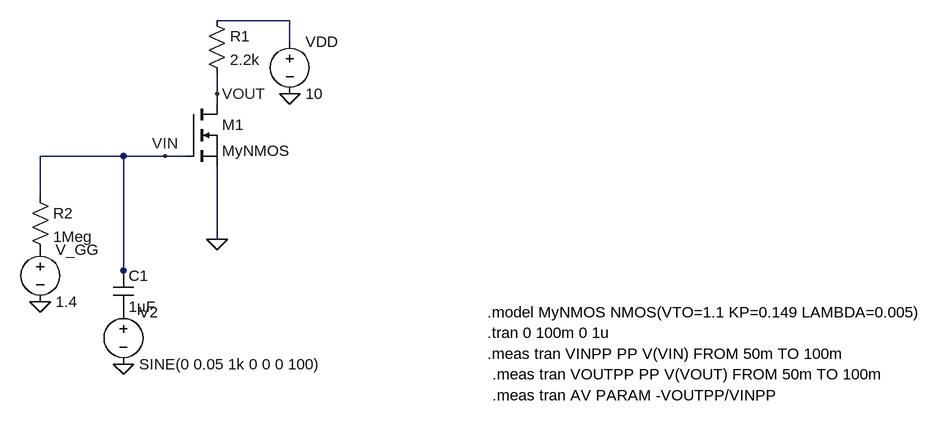
[diagram p0: schematic mosfet.asc]
mosfet.asc, the LTspice schematic file:
Version 4
SHEET 1 1856 680
WIRE 240 -128 128 -128
WIRE 240 -96 240 -128
WIRE 128 -16 128 -48
WIRE 128 0 128 -16
WIRE -16 80 -144 80
WIRE 48 80 -16 80
WIRE 80 80 48 80
WIRE -144 144 -144 80
WIRE 128 208 128 96
WIRE -16 256 -16 80
WIRE -16 272 -16 256
FLAG 240 -16 0
FLAG 128 208 0
FLAG -144 304 0
FLAG -16 400 0
FLAG 48 80 VIN
FLAG 128 -16 VOUT
SYMBOL nmos 80 0 R0
SYMATTR InstName M1
SYMATTR Value MyNMOS
SYMBOL voltage 240 -112 R0
SYMATTR InstName VDD
SYMATTR Value 10
SYMBOL Res 112 -144 R0
SYMATTR InstName R1
SYMATTR Value 2.2k
SYMBOL Res -160 128 R0
SYMATTR InstName R2
SYMATTR Value 1Meg
SYMBOL Cap -32 256 R0
SYMATTR InstName C1
SYMATTR Value 1µF
SYMBOL Voltage -144 208 R0
SYMATTR InstName V_GG
SYMATTR Value 1.4
SYMBOL Voltage -16 304 R0
SYMATTR InstName V2
SYMATTR Value SINE(0 0.05 1k 0 0 0 100)
TEXT 544 320 Left 2 !.model MyNMOS NMOS(VTO=1.1 KP=0.149 LAMBDA=0.005)
TEXT 544 352 Left 2 !.tran 0 100m 0 1u
TEXT 544 384 Left 2 !.meas tran VINPP PP V(VIN) FROM 50m TO 100m
TEXT 552 416 Left 2 !.meas tran VOUTPP PP V(VOUT) FROM 50m TO 100m
TEXT 552 448 Left 2 !.meas tran AV PARAM -VOUTPP/VINPP

The netlist it stands for:
* mosfet.asc
M1 VOUT VIN 0 0 MyNMOS
VDD N001 0 10
R1 N001 VOUT 2.2k
R2 VIN P001 1Meg
C1 VIN P002 1µF
V_GG P001 0 1.4
V2 P002 0 SINE(0 0.05 1k 0 0 0 100)
.model NMOS NMOS
.model PMOS PMOS
.lib standard.mos
.model MyNMOS NMOS(VTO=1.1 KP=0.149 LAMBDA=0.005)
.tran 0 100m 0 1u
.meas tran VINPP PP V(VIN) FROM 50m TO 100m
.meas tran VOUTPP PP V(VOUT) FROM 50m TO 100m
.meas tran AV PARAM -VOUTPP/VINPP
.backanno
.end